# Altium schematic sheet ESP32_EC.SchDoc (part 3 of 3)
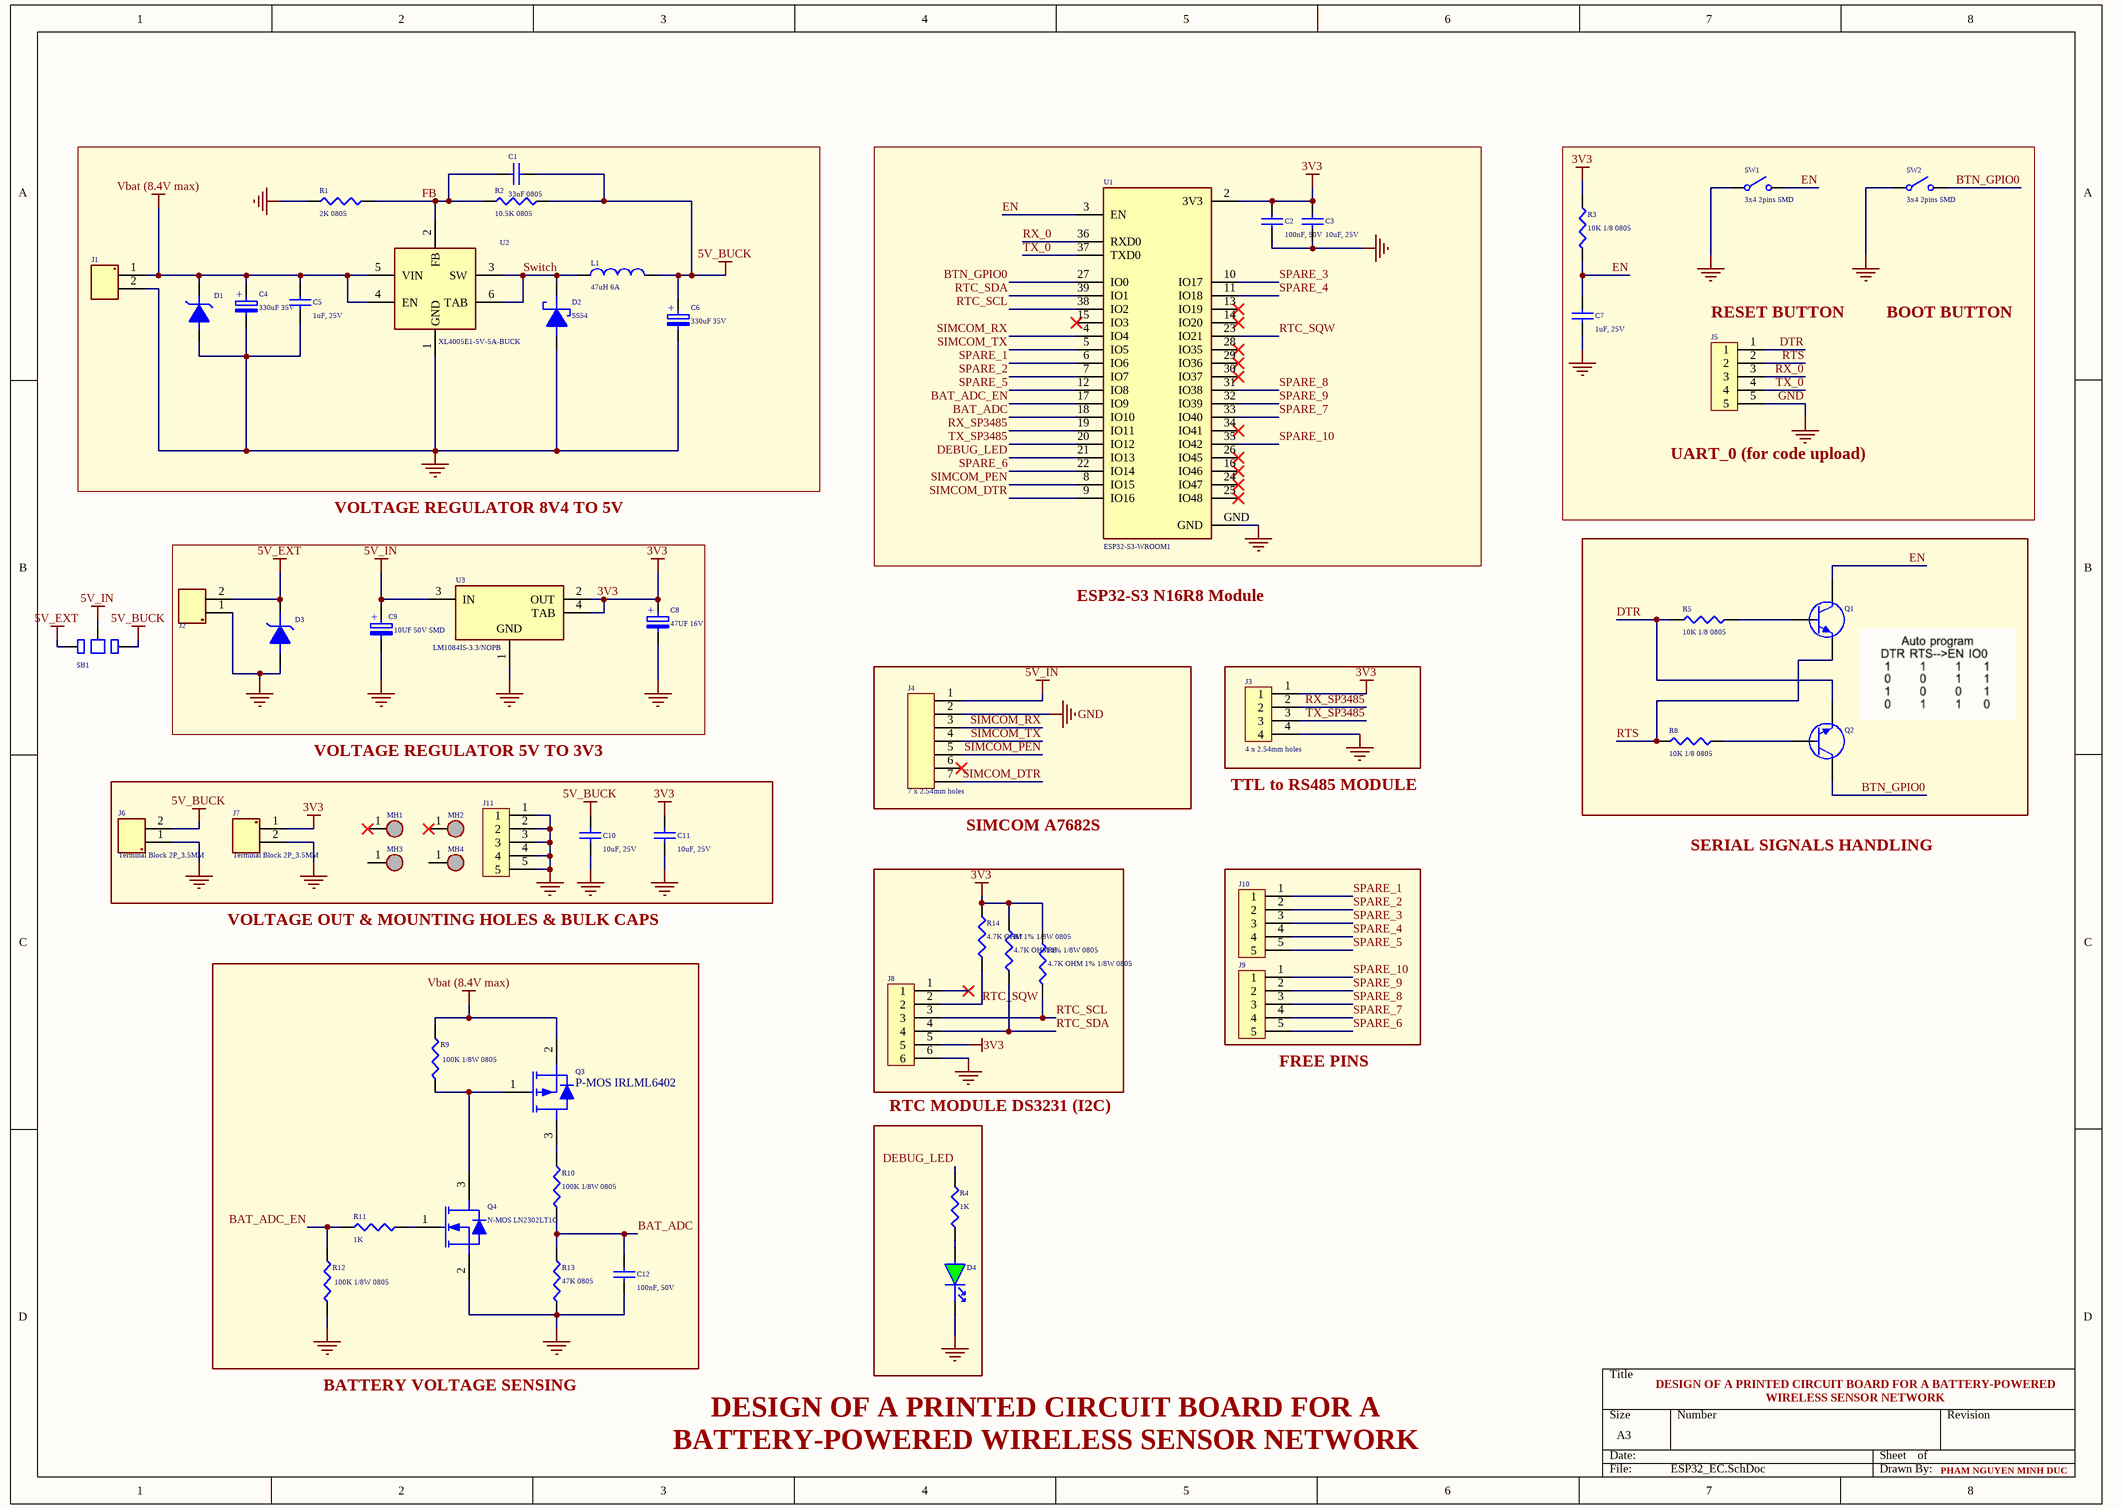
[diagram p2: ESP32_EC.SchDoc]

## Library data of the parts (continued)
R13 = RC0805FR-0747KL: RES 47K OHM 1% 1/8W 0805; Manufacturer: Yageo Group; Power Dissipation: 125mW; Value: 47kΩ; Temperature Coefficient: 100ppm/°C; Voltage Rating: 150V; Supplier: DigiKey; Supplier Part Number: 311-47.0KCRCT-ND; Manufacturer Part Number: RC0805FR-0747KL; RoHS: Compliant; Category: Chip SMD Resistors; Stock: 191777; Pricing: 1=0.1, 10=0.009, 25=0.0088, 50=0.0082, 100=0.0071 (USD); Case/Package: 0805; Case Code (Imperial): 0805; China RoHS: Non-Compliant; Composition: Thick Film; Contact Plating: Tin; Depth: 1.25mm; Height: 500µm; Lead Free: Lead Free; Length: 2mm; Lifecycle Status: Production; Max Operating Temperature: 155°C; Min Operating Temperature: -55°C; Mounting Technology: Surface Mount; Pins: 2; Number of Terminals: 2; Number of Terminations: 2; Packaging: Tape and Reel; Power Rating: 125mW; Radiation Hardening: No; REACH SVHC: Yes; Schedule B: 8533210045, 8533210045|8533210045, 8533210045|8533210045|8533210045, 8533210045|8533210045|8533210045|8533210045; Termination: SMD/SMT; Tolerance: 1%; Voltage Rating (AC): 150V; Voltage Rating (DC): 150V; Width: 1.25mm; Working Voltage: 150V; ComponentLink1URL: https://datasheet.octopart.com:443/RC0805FR-0747KL-Yageo-datasheet-175887523.pdf?src-supplier=IHS; ComponentLink1Description: https://datasheet.octopart.com:443/RC0805FR-0747KL-Yageo-datasheet-175887523.pdf?src-supplier=IHS; ComponentLink2URL: https://datasheet.octopart.com:443/RC0805FR-0747KL-Yageo-datasheet-62067350.pdf?src-supplier=element14+APAC; ComponentLink2Description: https://datasheet.octopart.com:443/RC0805FR-0747KL-Yageo-datasheet-62067350.pdf?src-supplier=element14+APAC; ComponentLink3URL: https://datasheet.octopart.com:443/RC0805FR-0747KL-Yageo-datasheet-8330313.pdf?src-supplier=element14+APAC; ComponentLink3Description: https://datasheet.octopart.com:443/RC0805FR-0747KL-Yageo-datasheet-8330313.pdf?src-supplier=element14+APAC; ComponentLink4URL: https://datasheet.octopart.com:443/RC0805FR-0747KL-Yageo-datasheet-103092701.pdf?src-supplier=Upverter; ComponentLink4Description: https://datasheet.octopart.com:443/RC0805FR-0747KL-Yageo-datasheet-103092701.pdf?src-supplier=Upverter; ComponentLink5URL: https://datasheet.octopart.com:443/RC0805FR-0747KL-Yageo-datasheet-98239111.pdf?src-supplier=Upverter; ComponentLink5Description: https://datasheet.octopart.com:443/RC0805FR-0747KL-Yageo-datasheet-98239111.pdf?src-supplier=Upverter; ComponentLink6URL: https://datasheet.octopart.com:443/RC0805FR-0747KL-Yageo-Group-datasheet-176638170.pdf?src-supplier=Future+Electronics; ComponentLink6Description: https://datasheet.octopart.com:443/RC0805FR-0747KL-Yageo-Group-datasheet-176638170.pdf?src-supplier=Future+Electronics; ComponentLink7URL: https://datasheet.octopart.com:443/RC0805FR-0747KL-Yageo-datasheet-164759695.pdf?src-supplier=Future+Electronics; ComponentLink7Description: https://datasheet.octopart.com:443/RC0805FR-0747KL-Yageo-datasheet-164759695.pdf?src-supplier=Future+Electronics; ComponentLink8URL: https://datasheet.octopart.com:443/RC0805FR-0747KL-Yageo-datasheet-12592811.pdf?src-supplier=Future+Electronics; ComponentLink8Description: https://datasheet.octopart.com:443/RC0805FR-0747KL-Yageo-datasheet-12592811.pdf?src-supplier=Future+Electronics; ComponentLink9URL: https://datasheet.octopart.com:443/RC0805FR-0747KL-Yageo-datasheet-8324252.pdf?src-supplier=Future+Electronics; ComponentLink9Description: https://datasheet.octopart.com:443/RC0805FR-0747KL-Yageo-datasheet-8324252.pdf?src-supplier=Future+Electronics; ComponentLink10URL: https://datasheet.octopart.com:443/RC0805FR-0747KL-Yageo-datasheet-79472498.pdf?src-supplier=Megastar; ComponentLink10Description: https://datasheet.octopart.com:443/RC0805FR-0747KL-Yageo-datasheet-79472498.pdf?src-supplier=Megastar; ComponentLink11URL: https://datasheet.octopart.com:443/RC0805FR-0747KL-Yageo-datasheet-27714392.pdf?src-supplier=Seeed+Studio; ComponentLink11Description: https://datasheet.octopart.com:443/RC0805FR-0747KL-Yageo-datasheet-27714392.pdf?src-supplier=Seeed+Studio; ComponentLink12URL: https://datasheet.octopart.com/RC0805FR-0747KL-Yageo-datasheet-73766026.pdf; ComponentLink12Description: https://datasheet.octopart.com/RC0805FR-0747KL-Yageo-datasheet-73766026.pdf; ComponentLink13URL: https://datasheet.octopart.com:443/RC0805FR-0747KL-Yageo-datasheet-13691069.pdf?src-supplier=Farnell; ComponentLink13Description: https://datasheet.octopart.com:443/RC0805FR-0747KL-Yageo-datasheet-13691069.pdf?src-supplier=Farnell; ComponentLink14URL: https://datasheet.octopart.com:443/RC0805FR-0747KL-Yageo-datasheet-118657.pdf?src-supplier=DigiKey; ComponentLink14Description: https://datasheet.octopart.com:443/RC0805FR-0747KL-Yageo-datasheet-118657.pdf?src-supplier=DigiKey; ComponentLink15URL: https://datasheet.octopart.com:443/RC0805FR-0747KL-Yageo-datasheet-502840.pdf?src-supplier=element14; ComponentLink15Description: https://datasheet.octopart.com:443/RC0805FR-0747KL-Yageo-datasheet-502840.pdf?src-supplier=element14; ComponentLink16URL: http://sigma.octopart.com:80/conflict_mineral_statement/Yageo-company-3.pdf?src-supplier=Compliance+Statements; ComponentLink16Description: http://sigma.octopart.com:80/conflict_mineral_statement/Yageo-company-3.pdf?src-supplier=Compliance+Statements; ComponentLink17URL: http://sigma.octopart.com:80/rohs_statement/Yageo-company-2.pdf?src-supplier=Compliance+Statements; ComponentLink17Description: http://sigma.octopart.com:80/rohs_statement/Yageo-company-2.pdf?src-supplier=Compliance+Statements; LCSC Part Number: C105579
SW1 SW2 = TS-1088-AR02016: Without 50mA 4mm 100MΩ 100000 Times 12V 160gf 3mm 2mm Round Button Standing paste SPST SMD Tactile Switches ROHS; LCSC Part Number: C720477
U2 = XL4005E1: XL4005E1-5V-5A-BUCK / 300KHz; Package: TO-263-5L
U3 = LM1084IS-3.3/NOPB: IC REG LINEAR 3.3V 5A TO263; Manufacturer: Texas Instruments; Manufacturer Lifecycle Status: ACTIVE; Dropout Voltage: 1.3V; Max Supply Voltage: 27V; Max Power Dissipation: 30W; Min Current Limit: 5.5A; Min Input Voltage: 2.6V; Number of Channels: 1; Output Type: Fixed; Polarity: Positive; Quiescent Current: 10mA; Supplier: Arrow Electronics; Supplier Part Number: LM1084IS-3.3/NOPB; Manufacturer Part Number: LM1084IS-3.3/NOPB; RoHS: Compliant; Category: LDO Voltage Regulators; Stock: 85; Pricing: 1=3.325, 10=2.486, 25=2.204 (USD); Case/Package: TO-263; Current Rating: 5A; Height: 4.83mm; Lead Free: Contains Lead; Length: 10.18mm; Lifecycle Status: Production; Max Operating Temperature: 125°C; Max Output current: 5A; Min Operating Temperature: -40°C; Mounting Technology: Surface Mount; Nominal Output Voltage: 3.3V; Number of Outputs: 1; Pins: 3; Number of Regulators: 1; Output Current: 5A; Output Voltage: 3.3V; Power Dissipation: 30W; Radiation Hardening: No; REACH SVHC: No; Schedule B: 8542390000, 8542390000|8542390000|8542390000|8542390000|8542390000|8542390000|8542390000|8542390000|8542390000|8542390000|8542390000|8542390000|8542390000|8542390000|8542390000|8542390000|8542390000|8542390000|8542390000|8542390000|8542390000|8542390000|8542390000|85; Thickness: 4.44mm; Weight: 113.398093g; Width: 8.41mm; ComponentLink1URL: https://datasheet.octopart.com:443/LM1084IS-3.3-NOPB-Texas-Instruments-datasheet-36834603.pdf?src-supplier=Farnell; ComponentLink1Description: https://datasheet.octopart.com:443/LM1084IS-3.3-NOPB-Texas-Instruments-datasheet-36834603.pdf?src-supplier=Farnell; ComponentLink2URL: https://octopart.com:443/opatz8j6/c1?t=w6vwqWfNppgvDygbXveTbClDM0ZnxyhdCHGzur0Nm6VEadmthkQzndR7s3Ajz8MLEFRhQ3UDka_f8COcniNFxrzJWTGIO3bk5hs1S7SsHSpYp2xDlcf4aJYdkGqn7GyG9QFfRscTRC8MpRePZIQmcWcJsyAVqzxwKd2qe9HT6rqpAEiSzx3lhvhiiMLhKmG65SlrnGiZ_vRKX3RdqzDDq8IML42iScMdYb8bI4AVealvVNZHUd0B-HvSGOc2NH6MwpAeGLWrFv1pDJgD9Da9zcNFi_yt1wulgeQkiDTOtaJ6DfIQVm6L8XiNZEVLJe4lirfj9lBNRZZMY79DqDQz1ZUurfLBoxnm0SzQwy_iUXY3z08JEKkfSBOK9XhfN4xy4gbj&src-supplier=Texas+Instruments; ComponentLink2Description: https://octopart.com:443/opatz8j6/c1?t=w6vwqWfNppgvDygbXveTbClDM0ZnxyhdCHGzur0Nm6VEadmthkQzndR7s3Ajz8MLEFRhQ3UDka_f8COcniNFxrzJWTGIO3bk5hs1S7SsHSpYp2xDlcf4aJYdkGqn7GyG9QFfRscTRC8MpRePZIQmcWcJsyAVqzxwKd2qe9HT6rqpAEiSzx3lhvhiiMLhKmG65SlrnGiZ_vRKX3RdqzDDq8IML42iScMdYb8bI4AVealvVNZHUd0B-HvSGOc2NH6MwpAeGLWrFv1pDJgD9Da9zcNFi_yt1wulgeQkiDTOtaJ6DfIQVm6L8XiNZEVLJe4lirfj9lBNRZZMY79DqDQz1ZUurfLBoxnm0SzQwy_iUXY3z08JEKkfSBOK9XhfN4xy4gbj&src-supplier=Texas+Instruments; ComponentLink3URL: https://sigma.octopart.com:443/49251900/technical_drawing/Texas-Instruments-LM1084IS-3.3-NOPB.pdf?src-supplier=Texas+Instruments; ComponentLink3Description: https://sigma.octopart.com:443/49251900/technical_drawing/Texas-Instruments-LM1084IS-3.3-NOPB.pdf?src-supplier=Texas+Instruments; ComponentLink4URL: https://datasheet.octopart.com:443/LM1084IS-3.3-NOPB-Texas-Instruments-datasheet-14446412.pdf?src-supplier=Texas+Instruments; ComponentLink4Description: https://datasheet.octopart.com:443/LM1084IS-3.3-NOPB-Texas-Instruments-datasheet-14446412.pdf?src-supplier=Texas+Instruments; ComponentLink5URL: https://datasheet.octopart.com:443/LM1084IS-3.3/NOPB-Texas-Instruments-datasheet-10621405.pdf?src-supplier=element14; ComponentLink5Description: https://datasheet.octopart.com:443/LM1084IS-3.3/NOPB-Texas-Instruments-datasheet-10621405.pdf?src-supplier=element14; ComponentLink6URL: https://datasheet.octopart.com:443/LM1084IS-3.3/NOPB-National-Semiconductor-datasheet-659.pdf?src-supplier=element14; ComponentLink6Description: https://datasheet.octopart.com:443/LM1084IS-3.3/NOPB-National-Semiconductor-datasheet-659.pdf?src-supplier=element14; ComponentLink7URL: https://datasheet.octopart.com:443/LM1084IS-3.3-NOPB-Texas-Instruments-datasheet-163658313.pdf?src-supplier=Augswan; ComponentLink7Description: https://datasheet.octopart.com:443/LM1084IS-3.3-NOPB-Texas-Instruments-datasheet-163658313.pdf?src-supplier=Augswan; ComponentLink8URL: https://datasheet.octopart.com:443/LM1084IS-3.3-NOPB-Texas-Instruments-datasheet-21076641.pdf?src-supplier=Newark; ComponentLink8Description: https://datasheet.octopart.com:443/LM1084IS-3.3-NOPB-Texas-Instruments-datasheet-21076641.pdf?src-supplier=Newark; ComponentLink9URL: https://datasheet.octopart.com:443/LM1084IS-3.3-NOPB-Texas-Instruments-datasheet-7825620.pdf?src-supplier=Jameco; ComponentLink9Description: https://datasheet.octopart.com:443/LM1084IS-3.3-NOPB-Texas-Instruments-datasheet-7825620.pdf?src-supplier=Jameco; ComponentLink10URL: http://sigma.octopart.com:80/reach_statement/Texas-Instruments-company-64.pdf?src-supplier=Compliance+Statements; ComponentLink10Description: http://sigma.octopart.com:80/reach_statement/Texas-Instruments-company-64.pdf?src-supplier=Compliance+Statements; ComponentLink11URL: http://sigma.octopart.com:80/conflict_mineral_statement/Texas-Instruments-company-63.pdf?src-supplier=Compliance+Statements; ComponentLink11Description: http://sigma.octopart.com:80/conflict_mineral_statement/Texas-Instruments-company-63.pdf?src-supplier=Compliance+Statements